# Altium schematic sheet 01_Power_RF.SchDoc: Power & Sensors (part 2 of 4)
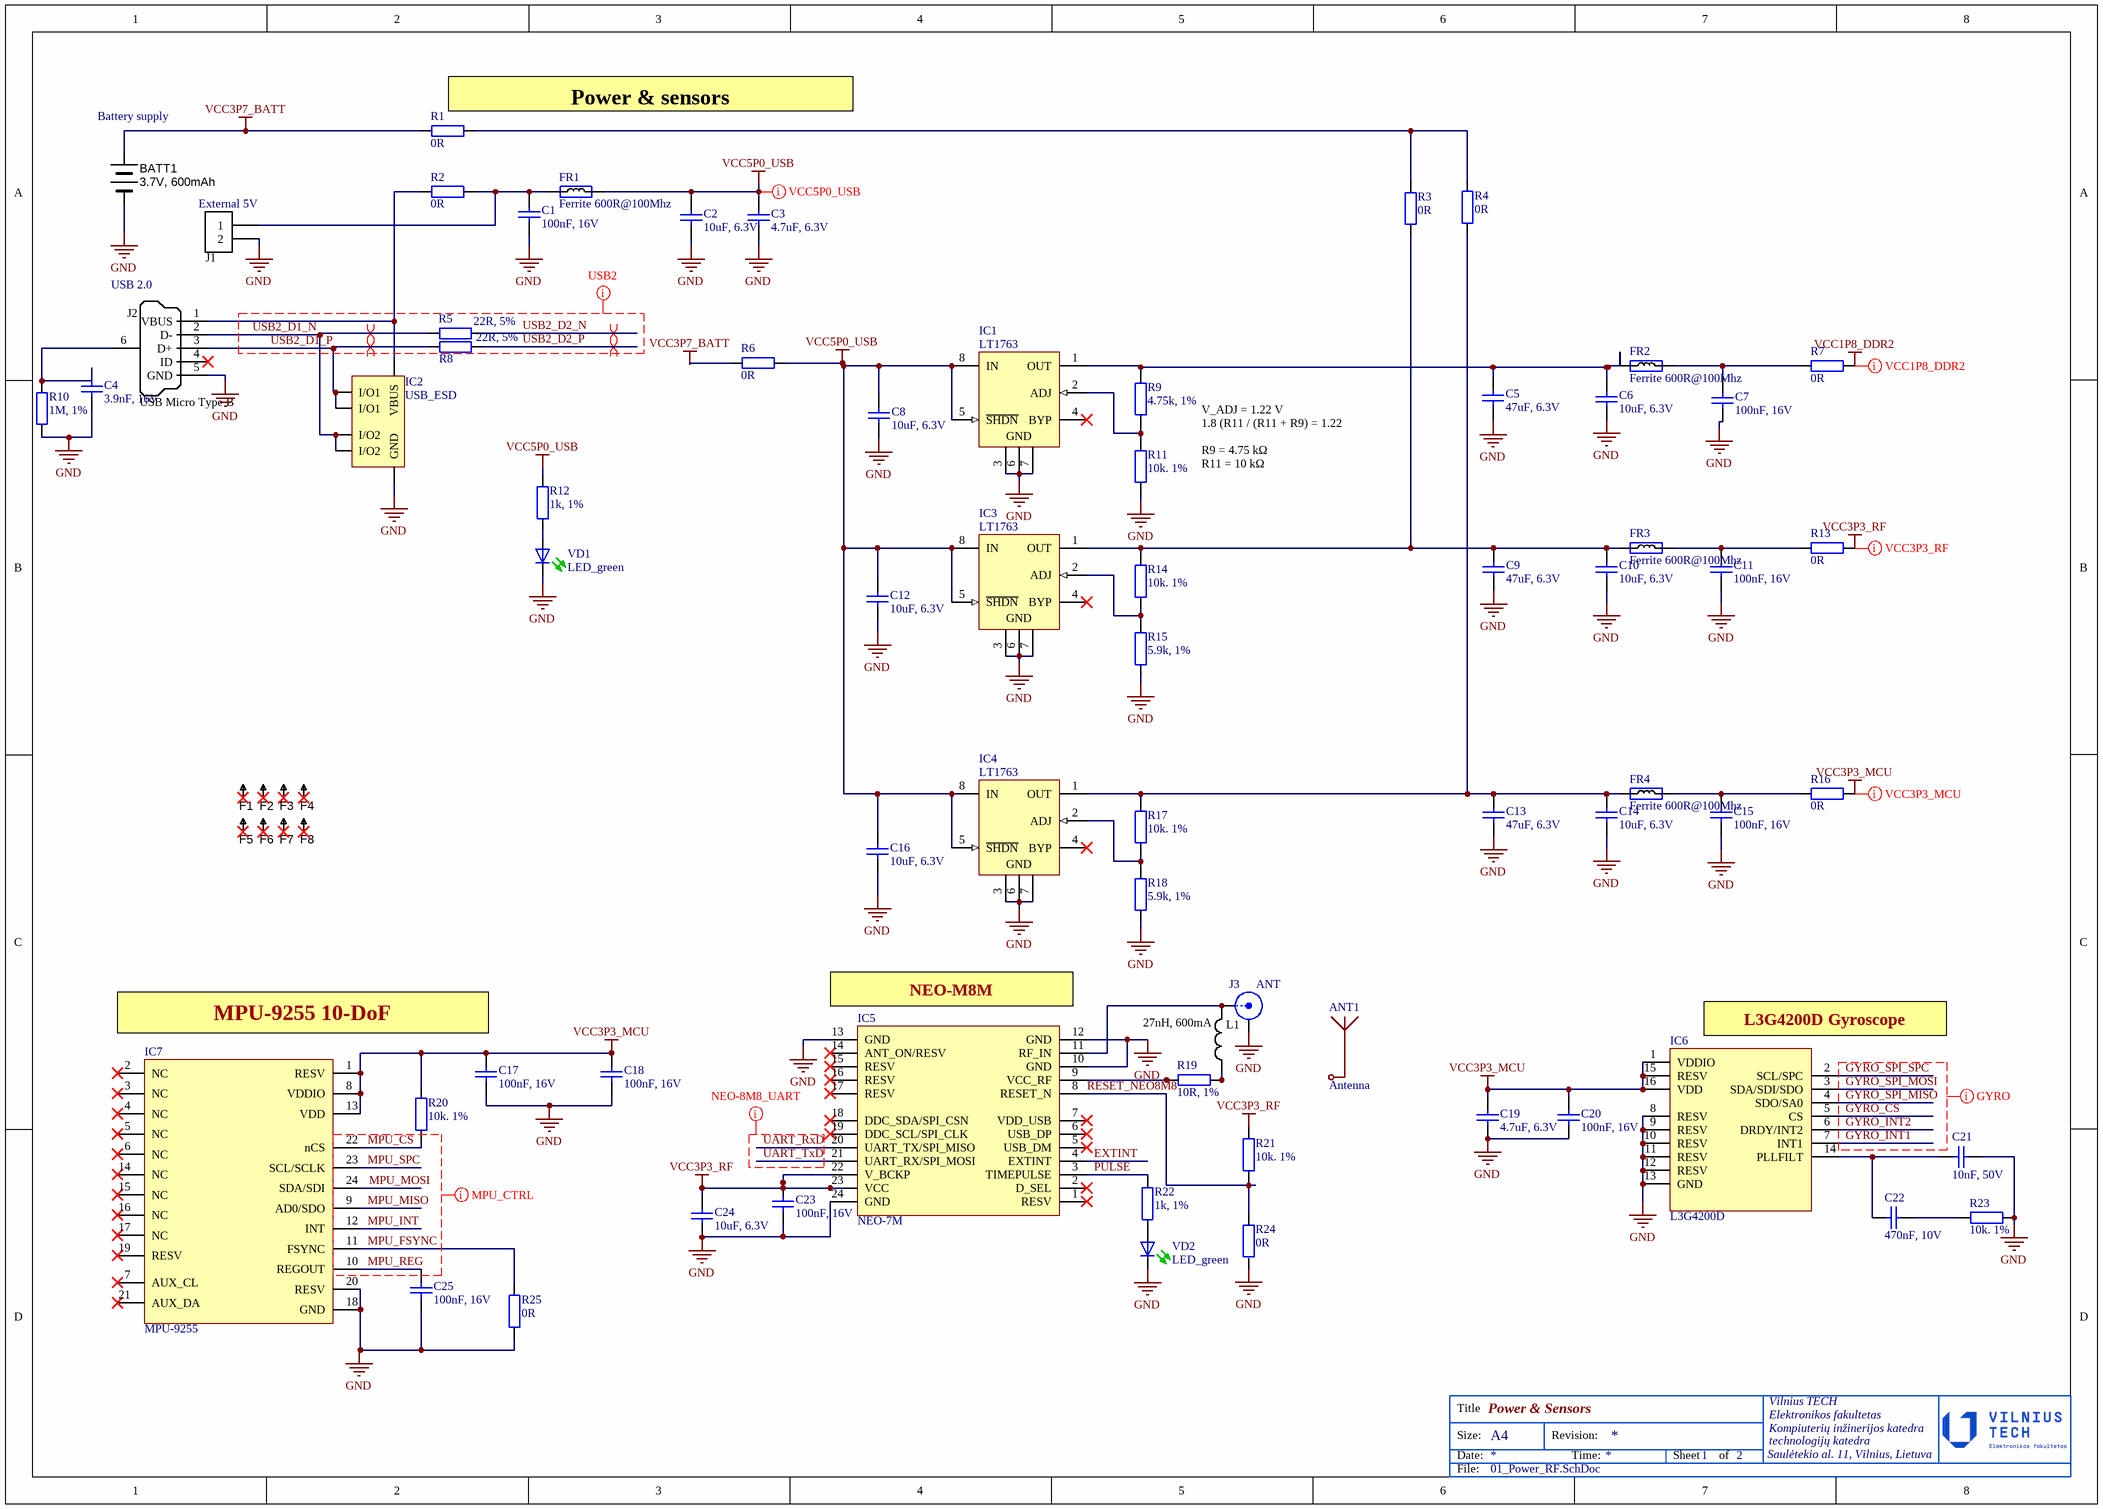
[diagram p1: 01_Power_RF.SchDoc]
## Library data of the parts
BATT1 = BATT: 42.5 x 25.7 x 6.5 mm 3.7 V 600 mAh Rechargeable Lithium Ion Polymer Battery Pack; Manufacturer: Renata; Manufacturer Part Number: ICP622540PMT; Approvals: IEC; Max Charge Current: 300mA; Number of Batteries: 1; Output Current: 600mA; Supplier: Mouser; Supplier Part Number: 614-ICP622540PMT; Category: Batteries and Accessories; Stock: 493; Pricing: 1=14.08, 10=11.74, 50=10.3, 100=9.75, 1000=9.72, 10000=9.72 (USD); Case/Package: 600; Chemistry/Technology: Lithium; Country of Origin: Switzerland; Export Control Classification Number (ECCN) Code: 3A991.J.2; Height: 6.5mm; Harmonized Tariff Schedule (HTS) Code: 8507.80.82.00; Introduction Date: 2018-12-20; Lead Free: Lead Free; Length: 42.5mm; Lifecycle Status: Production; Max Operating Temperature: 60°C; Min Operating Temperature: -20°C; Output Voltage: 3.7V; REACH SVHC: No; Termination: Wire; Voltage: 3.7V; Weight: 11g; Width: 25.7mm; ComponentLink1URL: https://datasheet.octopart.com:443/ICP622540PMT-Renata-datasheet-181185937.pdf?src-supplier=IHS; ComponentLink1Description: https://datasheet.octopart.com:443/ICP622540PMT-Renata-datasheet-181185937.pdf?src-supplier=IHS; ComponentLink2URL: https://datasheet.octopart.com:443/ICP622540PMT-Renata-datasheet-145014577.pdf?src-supplier=Future+Electronics; ComponentLink2Description: https://datasheet.octopart.com:443/ICP622540PMT-Renata-datasheet-145014577.pdf?src-supplier=Future+Electronics; ComponentLink3URL: https://datasheet.octopart.com:443/ICP622540PMT-Renata-datasheet-62059859.pdf?src-supplier=Future+Electronics; ComponentLink3Description: https://datasheet.octopart.com:443/ICP622540PMT-Renata-datasheet-62059859.pdf?src-supplier=Future+Electronics
C1 C7 C11 C15 C17 C18 C20 C23 C25 = Cap: 16V 100nF X7R ±10% 0402 Multilayer Ceramic Capacitors MLCC - SMD/SMT ROHS; Manufacturer: Murata; Manufacturer Part Number: GCM155R71C104KA55D; Manufacturer Lifecycle Status: IN PRODUCTION; Value: 100nF, 16V; Supplier: Farnell; Supplier Part Number: GCM155R71C104KA55D; RoHS: Compliant; Category: Ceramic Capacitors; Stock: 760000; Pricing: 10000=0.0057 (EUR); Case/Package: 0402; Case Code (Imperial): 0402; Case Code (Metric): 1005; Country of Origin: Philippines; Depth: 500µm; Dielectric: X7R; Dielectric Material: Ceramic; Export Control Classification Number (ECCN) Code: EAR99; Height: 500µm; Harmonized Tariff Schedule (HTS) Code: 8532.24.00.20; Introduction Date: 2007-06-21; Lead Free: Lead Free; Length: 1mm; Lifecycle Status: Production; Material: Ceramic; Max Operating Temperature: 125°C; Min Operating Temperature: -55°C; Mounting Technology: Surface Mount; Number of Terminals: 2; Packaging: Cut Tape; Radiation Hardening: No; Ratings: AEC-Q200; REACH SVHC: Yes; Schedule B: 8532240020, 8532240020|8532240020, 8532240020|8532240020|8532240020, 8532240020|8532240020|8532240020|8532240020; Termination: SMD/SMT; Tolerance: 10%; Voltage: 16V; Voltage Rating: 16V; Voltage Rating (DC): 16V; Width: 500µm; ComponentLink1URL: https://datasheet.octopart.com:443/GCM155R71C104KA55D-Murata-datasheet-149522428.pdf?src-supplier=Newark; ComponentLink1Description: https://datasheet.octopart.com:443/GCM155R71C104KA55D-Murata-datasheet-149522428.pdf?src-supplier=Newark; ComponentLink2URL: https://datasheet.octopart.com:443/GCM155R71C104KA55D-Murata-datasheet-11777063.pdf?src-supplier=_legacy+Avnet; ComponentLink2Description: https://datasheet.octopart.com:443/GCM155R71C104KA55D-Murata-datasheet-11777063.pdf?src-supplier=_legacy+Avnet; ComponentLink3URL: https://datasheet.octopart.com:443/GCM155R71C104KA55D-Murata-datasheet-14404342.pdf?src-supplier=Future+Electronics; ComponentLink3Description: https://datasheet.octopart.com:443/GCM155R71C104KA55D-Murata-datasheet-14404342.pdf?src-supplier=Future+Electronics; ComponentLink4URL: https://datasheet.octopart.com:443/GCM155R71C104KA55D-Murata-datasheet-44104237.pdf?src-supplier=Future+Electronics; ComponentLink4Description: https://datasheet.octopart.com:443/GCM155R71C104KA55D-Murata-datasheet-44104237.pdf?src-supplier=Future+Electronics; ComponentLink5URL: https://datasheet.octopart.com:443/GCM155R71C104KA55D-Murata-datasheet-165579661.pdf?src-supplier=TME; ComponentLink5Description: https://datasheet.octopart.com:443/GCM155R71C104KA55D-Murata-datasheet-165579661.pdf?src-supplier=TME; ComponentLink6URL: https://datasheet.octopart.com:443/GCM155R71C104KA55D-Murata-datasheet-62117434.pdf?src-supplier=TME; ComponentLink6Description: https://datasheet.octopart.com:443/GCM155R71C104KA55D-Murata-datasheet-62117434.pdf?src-supplier=TME; ComponentLink7URL: https://datasheet.octopart.com:443/GCM155R71C104KA55D-Murata-datasheet-141266224.pdf?src-supplier=Ciiva; ComponentLink7Description: https://datasheet.octopart.com:443/GCM155R71C104KA55D-Murata-datasheet-141266224.pdf?src-supplier=Ciiva; ComponentLink8URL: https://datasheet.octopart.com:443/GCM155R71C104KA55D-Murata-datasheet-140656701.pdf?src-supplier=Ciiva; ComponentLink8Description: https://datasheet.octopart.com:443/GCM155R71C104KA55D-Murata-datasheet-140656701.pdf?src-supplier=Ciiva; ComponentLink9URL: https://datasheet.octopart.com:443/GCM155R71C104KA55D-Murata-datasheet-138716406.pdf?src-supplier=Ciiva; ComponentLink9Description: https://datasheet.octopart.com:443/GCM155R71C104KA55D-Murata-datasheet-138716406.pdf?src-supplier=Ciiva; ComponentLink10URL: https://datasheet.octopart.com:443/GCM155R71C104KA55D-Murata-datasheet-12515163.pdf?src-supplier=Farnell; ComponentLink10Description: https://datasheet.octopart.com:443/GCM155R71C104KA55D-Murata-datasheet-12515163.pdf?src-supplier=Farnell; ComponentLink11URL: http://sigma.octopart.com:80/reach_statement/Murata-company-16.pdf?src-supplier=Compliance+Statements; ComponentLink11Description: http://sigma.octopart.com:80/reach_statement/Murata-company-16.pdf?src-supplier=Compliance+Statements
C2 C6 C8 C10 C12 C14 C16 C24 = Cap: 6.3V 10uF X5R 卤20% 0402 Multilayer Ceramic Capacitors MLCC - SMD/SMT ROHS; Manufacturer: Samsung Electro-Mechanics; Manufacturer Part Number: CL05A106MQ5NUNC; Tolerance: 20%; Value: 10uF, 6.3V; Supplier: Arrow Electronics; Supplier Part Number: CL05A106MQ5NUNC; RoHS: Compliant; Category: Ceramic Capacitors; Stock: 15790000; Pricing: 10000=0.0171, 20000=0.0168, 30000=0.0166, 50000=0.0158, 70000=0.0157, 100000=0.0154 (USD); Case/Package: 0402; Case Code (Imperial): 0402; Case Code (Metric): 1005; China RoHS: Compliant; Depth: 500µm; Dielectric: X5R; Dielectric Material: Ceramic; Height: 700µm; Length: 1mm; Lifecycle Status: Production; Max Operating Temperature: 85°C; Min Operating Temperature: -55°C; Mounting Technology: Surface Mount; Number of Terminals: 2; Radiation Hardening: No; REACH SVHC: Yes; Schedule B: 8532240020, 8532240020|8532240020, 8532240020|8532240020|8532240020, 8532240020|8532240020|8532240020|8532240020; Thickness: 711.2µm; Voltage Rating: 6.3V; Voltage Rating (DC): 6.3V; Width: 500µm; ComponentLink1URL: https://datasheet.octopart.com:443/CL05A106MQ5NUNC-Samsung-Electro-Mechanics-datasheet-136031724.pdf?src-supplier=Newark; ComponentLink1Description: https://datasheet.octopart.com:443/CL05A106MQ5NUNC-Samsung-Electro-Mechanics-datasheet-136031724.pdf?src-supplier=Newark; ComponentLink2URL: https://datasheet.octopart.com:443/CL05A106MQ5NUNC-Samsung-Electro-Mechanics-datasheet-181551184.pdf?src-supplier=Newark; ComponentLink2Description: https://datasheet.octopart.com:443/CL05A106MQ5NUNC-Samsung-Electro-Mechanics-datasheet-181551184.pdf?src-supplier=Newark; ComponentLink3URL: https://datasheet.octopart.com:443/CL05A106MQ5NUNC-Samsung-Electro-Mechanics-datasheet-110226207.pdf?src-supplier=Future+Electronics; ComponentLink3Description: https://datasheet.octopart.com:443/CL05A106MQ5NUNC-Samsung-Electro-Mechanics-datasheet-110226207.pdf?src-supplier=Future+Electronics; ComponentLink4URL: https://datasheet.octopart.com:443/CL05A106MQ5NUNC-Samsung-Electro-Mechanics-datasheet-81461596.pdf?src-supplier=Future+Electronics; ComponentLink4Description: https://datasheet.octopart.com:443/CL05A106MQ5NUNC-Samsung-Electro-Mechanics-datasheet-81461596.pdf?src-supplier=Future+Electronics; ComponentLink5URL: https://datasheet.octopart.com:443/CL05A106MQ5NUNC-Samsung-datasheet-42280528.pdf?src-supplier=Future+Electronics; ComponentLink5Description: https://datasheet.octopart.com:443/CL05A106MQ5NUNC-Samsung-datasheet-42280528.pdf?src-supplier=Future+Electronics; ComponentLink6URL: https://datasheet.octopart.com:443/CL05A106MQ5NUNC-Samsung-datasheet-34153003.pdf?src-supplier=Future+Electronics; ComponentLink6Description: https://datasheet.octopart.com:443/CL05A106MQ5NUNC-Samsung-datasheet-34153003.pdf?src-supplier=Future+Electronics; ComponentLink7URL: https://datasheet.octopart.com:443/CL05A106MQ5NUNC-Samsung-datasheet-26589001.pdf?src-supplier=Future+Electronics; ComponentLink7Description: https://datasheet.octopart.com:443/CL05A106MQ5NUNC-Samsung-datasheet-26589001.pdf?src-supplier=Future+Electronics; ComponentLink8URL: https://datasheet.octopart.com:443/CL05A106MQ5NUNC-Samsung-datasheet-12538126.pdf?src-supplier=Future+Electronics; ComponentLink8Description: https://datasheet.octopart.com:443/CL05A106MQ5NUNC-Samsung-datasheet-12538126.pdf?src-supplier=Future+Electronics; ComponentLink9URL: https://datasheet.octopart.com:443/CL05A106MQ5NUNC-Samsung-Electro-Mechanics-datasheet-149136671.pdf?src-supplier=Future+Electronics; ComponentLink9Description: https://datasheet.octopart.com:443/CL05A106MQ5NUNC-Samsung-Electro-Mechanics-datasheet-149136671.pdf?src-supplier=Future+Electronics; ComponentLink10URL: https://datasheet.octopart.com:443/CL05A106MQ5NUNC-Samsung-datasheet-59220082.pdf?src-supplier=TME; ComponentLink10Description: https://datasheet.octopart.com:443/CL05A106MQ5NUNC-Samsung-datasheet-59220082.pdf?src-supplier=TME
C3 C19 = Cap: 6.3V 4.7uF X5R 卤20% 0402 Multilayer Ceramic Capacitors MLCC - SMD/SMT ROHS; Manufacturer: Samsung Electro-Mechanics; Manufacturer Part Number: CL05A475MQ5NRNC; Tolerance: 20%; Value: 4.7uF, 6.3V; Supplier: Farnell; Supplier Part Number: CL05A475MQ5NRNC; RoHS: Compliant; Category: Ceramic Capacitors; Stock: 29033; Pricing: 10=0.0525, 100=0.0306, 500=0.0229, 2500=0.0172, 5000=0.0153 (EUR); Case/Package: 0402; Case Code (Imperial): 0402; Case Code (Metric): 1005; China RoHS: Compliant; Depth: 500µm; Dielectric: X5R; Dielectric Material: Ceramic; Height: 650µm; Length: 1mm; Lifecycle Status: Production; Max Operating Temperature: 85°C; Min Operating Temperature: -55°C; Mounting Technology: Surface Mount; Number of Terminals: 2; Radiation Hardening: No; REACH SVHC: Yes; Schedule B: 8532240020, 8532240020|8532240020, 8532240020|8532240020|8532240020, 8532240020|8532240020|8532240020|8532240020; Thickness: 558.8µm; Voltage Rating: 6.3V; Voltage Rating (DC): 6.3V; Width: 500µm; ComponentLink1URL: https://datasheet.octopart.com:443/CL05A475MQ5NRNC-Samsung-Electro-Mechanics-datasheet-136031739.pdf?src-supplier=IHS; ComponentLink1Description: https://datasheet.octopart.com:443/CL05A475MQ5NRNC-Samsung-Electro-Mechanics-datasheet-136031739.pdf?src-supplier=IHS; ComponentLink2URL: https://datasheet.octopart.com:443/CL05A475MQ5NRNC-Samsung-Electro-Mechanics-datasheet-159675397.pdf?src-supplier=ICpick; ComponentLink2Description: https://datasheet.octopart.com:443/CL05A475MQ5NRNC-Samsung-Electro-Mechanics-datasheet-159675397.pdf?src-supplier=ICpick; ComponentLink3URL: https://datasheet.octopart.com:443/CL05A475MQ5NRNC-Samsung-Electro-Mechanics-datasheet-130009127.pdf?src-supplier=Future+Electronics; ComponentLink3Description: https://datasheet.octopart.com:443/CL05A475MQ5NRNC-Samsung-Electro-Mechanics-datasheet-130009127.pdf?src-supplier=Future+Electronics; ComponentLink4URL: https://datasheet.octopart.com:443/CL05A475MQ5NRNC-Samsung-Electro-Mechanics-datasheet-81461613.pdf?src-supplier=Future+Electronics; ComponentLink4Description: https://datasheet.octopart.com:443/CL05A475MQ5NRNC-Samsung-Electro-Mechanics-datasheet-81461613.pdf?src-supplier=Future+Electronics; ComponentLink5URL: https://datasheet.octopart.com:443/CL05A475MQ5NRNC-Samsung-datasheet-34153550.pdf?src-supplier=Future+Electronics; ComponentLink5Description: https://datasheet.octopart.com:443/CL05A475MQ5NRNC-Samsung-datasheet-34153550.pdf?src-supplier=Future+Electronics; ComponentLink6URL: https://datasheet.octopart.com:443/CL05A475MQ5NRNC-Samsung-Electro-Mechanics-datasheet-81842477.pdf?src-supplier=Future+Electronics; ComponentLink6Description: https://datasheet.octopart.com:443/CL05A475MQ5NRNC-Samsung-Electro-Mechanics-datasheet-81842477.pdf?src-supplier=Future+Electronics; ComponentLink7URL: https://datasheet.octopart.com:443/CL05A475MQ5NRNC-Samsung-datasheet-12537359.pdf?src-supplier=Future+Electronics; ComponentLink7Description: https://datasheet.octopart.com:443/CL05A475MQ5NRNC-Samsung-datasheet-12537359.pdf?src-supplier=Future+Electronics; ComponentLink8URL: https://datasheet.octopart.com:443/CL05A475MQ5NRNC-Samsung-datasheet-26589016.pdf?src-supplier=Future+Electronics; ComponentLink8Description: https://datasheet.octopart.com:443/CL05A475MQ5NRNC-Samsung-datasheet-26589016.pdf?src-supplier=Future+Electronics; ComponentLink9URL: https://datasheet.octopart.com:443/CL05A475MQ5NRNC-Samsung-datasheet-8324245.pdf?src-supplier=Future+Electronics; ComponentLink9Description: https://datasheet.octopart.com:443/CL05A475MQ5NRNC-Samsung-datasheet-8324245.pdf?src-supplier=Future+Electronics; ComponentLink10URL: https://datasheet.octopart.com:443/CL05A475MQ5NRNC-Samsung-Electro-Mechanics-datasheet-149136697.pdf?src-supplier=Future+Electronics; ComponentLink10Description: https://datasheet.octopart.com:443/CL05A475MQ5NRNC-Samsung-Electro-Mechanics-datasheet-149136697.pdf?src-supplier=Future+Electronics; ComponentLink11URL: https://datasheet.octopart.com:443/CL05A475MQ5NRNC-Samsung-Electro-Mechanics-datasheet-11778223.pdf?src-supplier=Arrow+Electronics; ComponentLink11Description: https://datasheet.octopart.com:443/CL05A475MQ5NRNC-Samsung-Electro-Mechanics-datasheet-11778223.pdf?src-supplier=Arrow+Electronics; ComponentLink12URL: https://datasheet.octopart.com:443/CL05A475MQ5NRNC-Samsung-datasheet-8326407.pdf?src-supplier=TME; ComponentLink12Description: https://datasheet.octopart.com:443/CL05A475MQ5NRNC-Samsung-datasheet-8326407.pdf?src-supplier=TME
C4 = Cap: Cap, 0.0039Uf, 16V, Mlcc, 0402 Rohs Compliant: Yes |Kemet C0402C392J4JACAUTO; Manufacturer: Yageo Group; Dielectric Material: Ceramic; Voltage Rating (DC): 15V; Value: 3.9nF, 16V; Supplier: Farnell; Supplier Part Number: C0402C392J4JACAUTO; Manufacturer Part Number: C0402C392J4JACAUTO; RoHS: Compliant; Category: Ceramic Capacitors; Stock: 9420; Pricing: 10=0.296, 100=0.185, 500=0.149, 1000=0.126, 2000=0.121, 4000=0.116 (EUR); Case/Package: 0402; China RoHS: Compliant; Country of Origin: Mexico; Export Control Classification Number (ECCN) Code: EAR99; Height: 500µm; Harmonized Tariff Schedule (HTS) Code: 8532.24.00.20; Introduction Date: 2022-03-02; Length: 1mm; Lifecycle Status: Production; Max Operating Temperature: 125°C; Min Operating Temperature: -55°C; Mounting Technology: Surface Mount; Number of Terminals: 2; Ratings: AEC-Q200; REACH SVHC: Yes; Width: 500µm; ComponentLink1URL: https://datasheet.octopart.com:443/C0402C392J4JACAUTO-KEMET-datasheet-175574894.pdf?src-supplier=IHS; ComponentLink1Description: https://datasheet.octopart.com:443/C0402C392J4JACAUTO-KEMET-datasheet-175574894.pdf?src-supplier=IHS; ComponentLink2URL: https://datasheet.octopart.com:443/C0402C392J4JACAUTO-KEMET-datasheet-141421995.pdf?src-supplier=Farnell; ComponentLink2Description: https://datasheet.octopart.com:443/C0402C392J4JACAUTO-KEMET-datasheet-141421995.pdf?src-supplier=Farnell; ComponentLink3URL: https://datasheet.octopart.com:443/C0402C392J4JACAUTO-KEMET-datasheet-176334293.pdf?src-supplier=Newark; ComponentLink3Description: https://datasheet.octopart.com:443/C0402C392J4JACAUTO-KEMET-datasheet-176334293.pdf?src-supplier=Newark; ComponentLink4URL: https://datasheet.octopart.com:443/C0402C392J4JACAUTO-KEMET-datasheet-163667000.pdf?src-supplier=Newark; ComponentLink4Description: https://datasheet.octopart.com:443/C0402C392J4JACAUTO-KEMET-datasheet-163667000.pdf?src-supplier=Newark
C5 C9 C13 = Cap: Multilayer Ceramic Capacitors MLCC - SMD/SMT 47uF 6.3V X5R +/-20% 0805 Gen Purp; Manufacturer: TAIYO YUDEN; Manufacturer Part Number: JMK212BJ476MG-T; Manufacturer Package Identifier: 0805 (2012 metric); Tolerance: 20%; Value: 47uF, 6.3V; Supplier: Mouser; Supplier Part Number: 963-JMK212BJ476MG-T; RoHS: Compliant; Category: Ceramic Capacitors; Stock: 86470; Pricing: 1=0.46, 10=0.206, 50=0.206, 100=0.184, 1000=0.136, 10000=0.109 (USD); Case/Package: 0805; Case Code (Imperial): 0805; Case Code (Metric): 2012; Contact Plating: Nickel; Country of Origin: Japan, Mainland China, Malaysia, South Korea; Depth: 1.25mm; Dielectric: X5R; Dielectric Material: Ceramic; Export Control Classification Number (ECCN) Code: EAR99; Height: 1.25mm; Harmonized Tariff Schedule (HTS) Code: 8532.24.00.20; Introduction Date: 2007-05-22; Lead Free: Lead Free; Length: 2mm; Lifecycle Status: Obsolete; LTB Date: 2026-03-31; LTD Date: 2026-03-31; Max Operating Temperature: 85°C; Min Operating Temperature: -55°C; Mounting Technology: Surface Mount; Pins: 2; Number of Terminals: 2; Packaging: Cut Tape; Radiation Hardening: No; REACH SVHC: Yes; Termination: SMD/SMT; Thickness: 1.3462mm; Voltage Rating: 6.3V; Voltage Rating (DC): 6.3V; Width: 1.25mm; ComponentLink1URL: https://datasheet.octopart.com:443/JMK212BJ476MG-T-Taiyo-Yuden-datasheet-154807738.pdf?src-supplier=Newark; ComponentLink1Description: https://datasheet.octopart.com:443/JMK212BJ476MG-T-Taiyo-Yuden-datasheet-154807738.pdf?src-supplier=Newark; ComponentLink2URL: https://datasheet.octopart.com:443/JMK212BJ476MG-T-Taiyo-Yuden-datasheet-10851928.pdf?src-supplier=Newark; ComponentLink2Description: https://datasheet.octopart.com:443/JMK212BJ476MG-T-Taiyo-Yuden-datasheet-10851928.pdf?src-supplier=Newark; ComponentLink3URL: https://datasheet.octopart.com:443/CEJMK212BJ476MG-T-Taiyo-Yuden-datasheet-159617017.pdf?src-supplier=IHS; ComponentLink3Description: https://datasheet.octopart.com:443/CEJMK212BJ476MG-T-Taiyo-Yuden-datasheet-159617017.pdf?src-supplier=IHS; ComponentLink4URL: https://datasheet.octopart.com:443/JMK212BJ476MG-T-Taiyo-Yuden-datasheet-140424376.pdf?src-supplier=Master+Electronics; ComponentLink4Description: https://datasheet.octopart.com:443/JMK212BJ476MG-T-Taiyo-Yuden-datasheet-140424376.pdf?src-supplier=Master+Electronics; ComponentLink5URL: https://datasheet.octopart.com:443/JMK212BJ476MG-T-Taiyo-Yuden-datasheet-138516745.pdf?src-supplier=Master+Electronics; ComponentLink5Description: https://datasheet.octopart.com:443/JMK212BJ476MG-T-Taiyo-Yuden-datasheet-138516745.pdf?src-supplier=Master+Electronics; ComponentLink6URL: https://datasheet.octopart.com:443/CEJMK212BJ476MG-T-Taiyo-Yuden-datasheet-154807850.pdf?src-supplier=Master+Electronics; ComponentLink6Description: https://datasheet.octopart.com:443/CEJMK212BJ476MG-T-Taiyo-Yuden-datasheet-154807850.pdf?src-supplier=Master+Electronics; ComponentLink7URL: https://datasheet.octopart.com:443/JMK212BJ476MG-T-Taiyo-Yuden-datasheet-99833423.pdf?src-supplier=Future+Electronics; ComponentLink7Description: https://datasheet.octopart.com:443/JMK212BJ476MG-T-Taiyo-Yuden-datasheet-99833423.pdf?src-supplier=Future+Electronics; ComponentLink8URL: https://datasheet.octopart.com:443/JMK212BJ476MG-T-Taiyo-Yuden-datasheet-99833418.pdf?src-supplier=Future+Electronics; ComponentLink8Description: https://datasheet.octopart.com:443/JMK212BJ476MG-T-Taiyo-Yuden-datasheet-99833418.pdf?src-supplier=Future+Electronics; ComponentLink9URL: https://datasheet.octopart.com:443/CEJMK212BJ476MG-T-Taiyo-Yuden-datasheet-62339906.pdf?src-supplier=Electro+Sonic; ComponentLink9Description: https://datasheet.octopart.com:443/CEJMK212BJ476MG-T-Taiyo-Yuden-datasheet-62339906.pdf?src-supplier=Electro+Sonic; ComponentLink10URL: https://datasheet.octopart.com:443/JMK212BJ476MG-T-Taiyo-Yuden-datasheet-62109412.pdf?src-supplier=Electro+Sonic; ComponentLink10Description: https://datasheet.octopart.com:443/JMK212BJ476MG-T-Taiyo-Yuden-datasheet-62109412.pdf?src-supplier=Electro+Sonic; ComponentLink11URL: https://datasheet.octopart.com:443/JMK212BJ476MG-T-Taiyo-Yuden-datasheet-41579547.pdf?src-supplier=Electro+Sonic; ComponentLink11Description: https://datasheet.octopart.com:443/JMK212BJ476MG-T-Taiyo-Yuden-datasheet-41579547.pdf?src-supplier=Electro+Sonic; ComponentLink12URL: https://datasheet.octopart.com:443/JMK212BJ476MG-T-Taiyo-Yuden-datasheet-27089081.pdf?src-supplier=Electro+Sonic; ComponentLink12Description: https://datasheet.octopart.com:443/JMK212BJ476MG-T-Taiyo-Yuden-datasheet-27089081.pdf?src-supplier=Electro+Sonic; ComponentLink13URL: https://datasheet.octopart.com:443/JMK212BJ476MG-T-Taiyo-Yuden-datasheet-13694273.pdf?src-supplier=_legacy+Avnet; ComponentLink13Description: https://datasheet.octopart.com:443/JMK212BJ476MG-T-Taiyo-Yuden-datasheet-13694273.pdf?src-supplier=_legacy+Avnet; ComponentLink14URL: https://datasheet.octopart.com:443/JMK212BJ476MG-T-Taiyo-Yuden-datasheet-10742123.pdf?src-supplier=Factory+Futures; ComponentLink14Description: https://datasheet.octopart.com:443/JMK212BJ476MG-T-Taiyo-Yuden-datasheet-10742123.pdf?src-supplier=Factory+Futures; ComponentLink15URL: https://datasheet.octopart.com:443/JMK212BJ476MG-T-Taiyo-Yuden-datasheet-8857305.pdf?src-supplier=element14; ComponentLink15Description: https://datasheet.octopart.com:443/JMK212BJ476MG-T-Taiyo-Yuden-datasheet-8857305.pdf?src-supplier=element14; ComponentLink16URL: https://datasheet.octopart.com:443/JMK212BJ476MG-T-Taiyo-Yuden-datasheet-8434558.pdf?src-supplier=element14; ComponentLink16Description: https://datasheet.octopart.com:443/JMK212BJ476MG-T-Taiyo-Yuden-datasheet-8434558.pdf?src-supplier=element14; ComponentLink17URL: https://datasheet.octopart.com:443/JMK212BJ476MG-T-Taiyo-Yuden-datasheet-118905.pdf?src-supplier=DigiKey; ComponentLink17Description: https://datasheet.octopart.com:443/JMK212BJ476MG-T-Taiyo-Yuden-datasheet-118905.pdf?src-supplier=DigiKey
C21 = Cap: 50V 10nF X7R ±10% 0402 Multilayer Ceramic Capacitors MLCC - SMD/SMT ROHS; Manufacturer: Murata; Manufacturer Part Number: GCM155R71H103KA55D; Manufacturer Lifecycle Status: IN PRODUCTION; Value: 10nF, 50V; Supplier: Farnell; Supplier Part Number: GCM155R71H103KA55D; RoHS: Compliant; Category: Ceramic Capacitors; Stock: 3754485; Pricing: 10=0.0162, 100=0.0134, 500=0.0096, 2500=0.0076, 5000=0.0067 (EUR); Case/Package: 0402; Case Code (Imperial): 0402; Case Code (Metric): 1005; Country of Origin: Philippines; Depth: 500µm; Dielectric: X7R; Dielectric Material: Ceramic; Export Control Classification Number (ECCN) Code: EAR99; Height: 500µm; Harmonized Tariff Schedule (HTS) Code: 8532.24.00.20; Introduction Date: 2007-06-21; Lead Free: Lead Free; Length: 1mm; Lifecycle Status: Production; Material: Ceramic; Max Operating Temperature: 125°C; Min Operating Temperature: -55°C; Mounting Technology: Surface Mount; Number of Terminals: 2; Packaging: Cut Tape; Radiation Hardening: No; Ratings: AEC-Q200; REACH SVHC: Yes; Schedule B: 8532240020, 8532240020|8532240020, 8532240020|8532240020|8532240020, 8532240020|8532240020|8532240020|8532240020; Termination: SMD/SMT; Tolerance: 10%; Voltage: 50V; Voltage Rating: 50V; Voltage Rating (DC): 50V; Width: 500µm; ComponentLink1URL: https://datasheet.octopart.com:443/GCM155R71H103KA55D-Murata-datasheet-149522462.pdf?src-supplier=Farnell; ComponentLink1Description: https://datasheet.octopart.com:443/GCM155R71H103KA55D-Murata-datasheet-149522462.pdf?src-supplier=Farnell; ComponentLink2URL: https://datasheet.octopart.com:443/GCM155R71H103KA55D-Murata-datasheet-39128434.pdf?src-supplier=Newark; ComponentLink2Description: https://datasheet.octopart.com:443/GCM155R71H103KA55D-Murata-datasheet-39128434.pdf?src-supplier=Newark; ComponentLink3URL: https://datasheet.octopart.com:443/GCM155R71H103KA55D-Murata-datasheet-62316942.pdf?src-supplier=element14+APAC; ComponentLink3Description: https://datasheet.octopart.com:443/GCM155R71H103KA55D-Murata-datasheet-62316942.pdf?src-supplier=element14+APAC; ComponentLink4URL: https://datasheet.octopart.com:443/GCM155R71H103KA55D-Murata-datasheet-12541648.pdf?src-supplier=_legacy+Avnet; ComponentLink4Description: https://datasheet.octopart.com:443/GCM155R71H103KA55D-Murata-datasheet-12541648.pdf?src-supplier=_legacy+Avnet; ComponentLink5URL: https://datasheet.octopart.com:443/GCM155R71H103KA55D-Murata-datasheet-14404350.pdf?src-supplier=Future+Electronics; ComponentLink5Description: https://datasheet.octopart.com:443/GCM155R71H103KA55D-Murata-datasheet-14404350.pdf?src-supplier=Future+Electronics; ComponentLink6URL: https://datasheet.octopart.com:443/GCM155R71H103KA55D-Murata-datasheet-44104302.pdf?src-supplier=Future+Electronics; ComponentLink6Description: https://datasheet.octopart.com:443/GCM155R71H103KA55D-Murata-datasheet-44104302.pdf?src-supplier=Future+Electronics; ComponentLink7URL: https://datasheet.octopart.com:443/GCM155R71H103KA55D-Murata-datasheet-141266224.pdf?src-supplier=Ciiva; ComponentLink7Description: https://datasheet.octopart.com:443/GCM155R71H103KA55D-Murata-datasheet-141266224.pdf?src-supplier=Ciiva; ComponentLink8URL: https://datasheet.octopart.com:443/GCM155R71H103KA55D-Murata-datasheet-140656749.pdf?src-supplier=Ciiva; ComponentLink8Description: https://datasheet.octopart.com:443/GCM155R71H103KA55D-Murata-datasheet-140656749.pdf?src-supplier=Ciiva; ComponentLink9URL: https://datasheet.octopart.com:443/GCM155R71H103KA55D-Murata-datasheet-138716454.pdf?src-supplier=Ciiva; ComponentLink9Description: https://datasheet.octopart.com:443/GCM155R71H103KA55D-Murata-datasheet-138716454.pdf?src-supplier=Ciiva; ComponentLink10URL: https://datasheet.octopart.com:443/GCM155R71H103KA55D-Murata-datasheet-12511495.pdf?src-supplier=TME; ComponentLink10Description: https://datasheet.octopart.com:443/GCM155R71H103KA55D-Murata-datasheet-12511495.pdf?src-supplier=TME; ComponentLink11URL: http://sigma.octopart.com:80/reach_statement/Murata-company-16.pdf?src-supplier=Compliance+Statements; ComponentLink11Description: http://sigma.octopart.com:80/reach_statement/Murata-company-16.pdf?src-supplier=Compliance+Statements
C22 = Cap: 10V 470nF X5R ±10% 0402 Multilayer Ceramic Capacitors MLCC - SMD/SMT ROHS; Manufacturer: Murata; Manufacturer Part Number: GRM155R61A474KE15D; Manufacturer Lifecycle Status: NRND; Manufacturer Package Identifier: GRM15-0.1; Dissipation Factor: 0.1%; Value: 470nF, 10V; Supplier: Arrow Electronics; Supplier Part Number: GRM155R61A474KE15D; RoHS: Compliant; Category: Ceramic Capacitors; Stock: 1130000; Pricing: 10000=0.0133, 20000=0.0132, 30000=0.013, 50000=0.0129, 70000=0.0127, 100000=0.0111 (USD); Case/Package: 0402; Case Code (Imperial): 0402; Case Code (Metric): 1005; Country of Origin: Philippines; Depth: 500µm; Dielectric: X5R; Dielectric Material: Ceramic; Export Control Classification Number (ECCN) Code: EAR99; Height: 500µm; Harmonized Tariff Schedule (HTS) Code: 8532.24.00.20; Introduction Date: 2006-06-22; Lead Free: Lead Free; Length: 1mm; Lifecycle Status: NRND; Material: Ceramic; Max Operating Temperature: 85°C; Min Operating Temperature: -55°C; Mounting Technology: Surface Mount; Pins: 2; Number of Terminals: 2; Packaging: Cut Tape; Radiation Hardening: No; REACH SVHC: Yes; Schedule B: 8532240020, 8532240020|8532240020, 8532240020|8532240020|8532240020, 8532240020|8532240020|8532240020|8532240020; Termination: SMD/SMT; Thickness: 500µm; Tolerance: 10%; Voltage: 10V; Voltage Rating: 10V; Voltage Rating (DC): 10V; Width: 500µm; ComponentLink1URL: https://datasheet.octopart.com:443/GRM155R61A474KE15D-Murata-datasheet-62317107.pdf?src-supplier=element14+APAC; ComponentLink1Description: https://datasheet.octopart.com:443/GRM155R61A474KE15D-Murata-datasheet-62317107.pdf?src-supplier=element14+APAC; ComponentLink2URL: https://datasheet.octopart.com:443/GRM155R61A474KE15D-Murata-datasheet-17853093.pdf?src-supplier=element14+APAC; ComponentLink2Description: https://datasheet.octopart.com:443/GRM155R61A474KE15D-Murata-datasheet-17853093.pdf?src-supplier=element14+APAC; ComponentLink3URL: https://datasheet.octopart.com:443/GRM155R61A474KE15D-Murata-datasheet-8817987.pdf?src-supplier=Newark; ComponentLink3Description: https://datasheet.octopart.com:443/GRM155R61A474KE15D-Murata-datasheet-8817987.pdf?src-supplier=Newark; ComponentLink4URL: https://datasheet.octopart.com:443/GRM155R61A474KE15D-Murata-datasheet-8332149.pdf?src-supplier=_legacy+Avnet; ComponentLink4Description: https://datasheet.octopart.com:443/GRM155R61A474KE15D-Murata-datasheet-8332149.pdf?src-supplier=_legacy+Avnet; ComponentLink5URL: https://datasheet.octopart.com:443/GRM155R61A474KE15D-Murata-datasheet-165579666.pdf?src-supplier=TME; ComponentLink5Description: https://datasheet.octopart.com:443/GRM155R61A474KE15D-Murata-datasheet-165579666.pdf?src-supplier=TME; ComponentLink6URL: https://datasheet.octopart.com:443/GRM155R61A474KE15D-Murata-datasheet-141266224.pdf?src-supplier=Ciiva; ComponentLink6Description: https://datasheet.octopart.com:443/GRM155R61A474KE15D-Murata-datasheet-141266224.pdf?src-supplier=Ciiva; ComponentLink7URL: https://datasheet.octopart.com:443/GRM155R61A474KE15D-Murata-datasheet-140690082.pdf?src-supplier=Ciiva; ComponentLink7Description: https://datasheet.octopart.com:443/GRM155R61A474KE15D-Murata-datasheet-140690082.pdf?src-supplier=Ciiva; ComponentLink8URL: https://datasheet.octopart.com:443/GRM155R61A474KE15D-Murata-datasheet-138740728.pdf?src-supplier=Ciiva; ComponentLink8Description: https://datasheet.octopart.com:443/GRM155R61A474KE15D-Murata-datasheet-138740728.pdf?src-supplier=Ciiva; ComponentLink9URL: https://datasheet.octopart.com:443/GRM155R61A474KE15D-Murata-datasheet-22122223.pdf?src-supplier=Future+Electronics; ComponentLink9Description: https://datasheet.octopart.com:443/GRM155R61A474KE15D-Murata-datasheet-22122223.pdf?src-supplier=Future+Electronics; ComponentLink10URL: https://datasheet.octopart.com:443/GRM155R61A474KE15D-Murata-datasheet-14396880.pdf?src-supplier=Future+Electronics; ComponentLink10Description: https://datasheet.octopart.com:443/GRM155R61A474KE15D-Murata-datasheet-14396880.pdf?src-supplier=Future+Electronics; ComponentLink11URL: https://datasheet.octopart.com:443/GRM155R61A474KE15D-Murata-datasheet-44106186.pdf?src-supplier=Future+Electronics; ComponentLink11Description: https://datasheet.octopart.com:443/GRM155R61A474KE15D-Murata-datasheet-44106186.pdf?src-supplier=Future+Electronics; ComponentLink12URL: https://datasheet.octopart.com/GRM155R61A474KE15D-Murata-datasheet-12515295.pdf; ComponentLink12Description: https://datasheet.octopart.com/GRM155R61A474KE15D-Murata-datasheet-12515295.pdf; ComponentLink13URL: https://datasheet.octopart.com/GRM155R61A474KE15D-Murata-datasheet-12510076.pdf; ComponentLink13Description: https://datasheet.octopart.com/GRM155R61A474KE15D-Murata-datasheet-12510076.pdf; ComponentLink14URL: https://datasheet.octopart.com/GRM155R61A474KE15D-Murata-datasheet-11978611.pdf; ComponentLink14Description: https://datasheet.octopart.com/GRM155R61A474KE15D-Murata-datasheet-11978611.pdf; ComponentLink15URL: https://datasheet.octopart.com/GRM155R61A474KE15D-Murata-datasheet-10025737.pdf; ComponentLink15Description: https://datasheet.octopart.com/GRM155R61A474KE15D-Murata-datasheet-10025737.pdf; ComponentLink16URL: https://datasheet.octopart.com/GRM155R61A474KE15D-Murata-datasheet-8819587.pdf; ComponentLink16Description: https://datasheet.octopart.com/GRM155R61A474KE15D-Murata-datasheet-8819587.pdf; ComponentLink17URL: https://datasheet.octopart.com/GRM155R61A474KE15D-Murata-datasheet-14396879.pdf; ComponentLink17Description: https://datasheet.octopart.com/GRM155R61A474KE15D-Murata-datasheet-14396879.pdf; ComponentLink18URL: https://datasheet.octopart.com:443/GRM155R61A474KE15D-Murata-datasheet-11969797.pdf?src-supplier=Arrow+Electronics; ComponentLink18Description: https://datasheet.octopart.com:443/GRM155R61A474KE15D-Murata-datasheet-11969797.pdf?src-supplier=Arrow+Electronics; ComponentLink19URL: https://datasheet.octopart.com:443/GRM155R61A474KE15D-Murata-datasheet-118811.pdf?src-supplier=DigiKey; ComponentLink19Description: https://datasheet.octopart.com:443/GRM155R61A474KE15D-Murata-datasheet-118811.pdf?src-supplier=DigiKey; ComponentLink20URL: http://sigma.octopart.com:80/reach_statement/Murata-company-16.pdf?src-supplier=Compliance+Statements; ComponentLink20Description: http://sigma.octopart.com:80/reach_statement/Murata-company-16.pdf?src-supplier=Compliance+Statements
FR1-FR4 = Ferrite: Ferrite Beads Multi-Layer 600Ohm 25% 100MHz 500mA 380mOhm DCR 0603 Automotive Paper T/R; Manufacturer: Murata; Manufacturer Part Number: BLM18AG601SN1D; DC Resistance (DCR): 380mΩ; Impedance: 600Ω; Number of Circuits: 1; Value: 380mΩ; Shielding: Unshielded; Supplier: Farnell; Supplier Part Number: BLM18AG601SN1D; RoHS: Compliant; Category: Ferrite Beads and Chips; Stock: 228982; Pricing: 10=0.0535, 100=0.0382, 500=0.0296, 1000=0.0258, 2000=0.023, 4000=0.0201 (EUR); Case/Package: 0603; Case Code (Imperial): 0603; Case Code (Metric): 1608; Core Material: Ferrite; Country of Origin: Japan, Thailand; Current Rating: 500mA; DC Current: 500mA; Depth: 800µm; Export Control Classification Number (ECCN) Code: EAR99; Frequency: 100MHz; Height: 800µm; Harmonized Tariff Schedule (HTS) Code: 8504.50.80.00; Introduction Date: 2001-08-28; Lead Free: Lead Free; Length: 1.6mm; Lifecycle Status: Production; Material: Ferrite, Steel; Max Current Rating: 500mA; Max DC Current: 500mA; Clock Frequency: 100MHz; Max Operating Temperature: 125°C; Military Standard: Not; Min Operating Temperature: -55°C; Mounting Technology: Surface Mount; Number of Lines: 1; Pins: 2; Number of Terminals: 2; Packaging: Cut Tape; Radiation Hardening: No; REACH SVHC: Yes; RMS Current (Irms): 500mA; Schedule B: 8543706000, 8543706000|8543706000, 8543706000|8543706000|8543706000, 8543706000|8543706000|8543706000|8543706000; ESR: 380mΩ; Termination: SMD/SMT; Test Frequency: 100MHz; Tolerance: 25%; Weight: 2.012816mg; Width: 800µm; ComponentLink1URL: https://datasheet.octopart.com:443/BLM18AG601SN1D-Murata-datasheet-180806579.pdf?src-supplier=IHS; ComponentLink1Description: https://datasheet.octopart.com:443/BLM18AG601SN1D-Murata-datasheet-180806579.pdf?src-supplier=IHS; ComponentLink2URL: https://datasheet.octopart.com:443/BLM18AG601SN1D-Murata-datasheet-41195.pdf?src-supplier=Upverter; ComponentLink2Description: https://datasheet.octopart.com:443/BLM18AG601SN1D-Murata-datasheet-41195.pdf?src-supplier=Upverter; ComponentLink3URL: https://datasheet.octopart.com:443/BLM18AG601SN1D-Murata-datasheet-11743096.pdf?src-supplier=Newark; ComponentLink3Description: https://datasheet.octopart.com:443/BLM18AG601SN1D-Murata-datasheet-11743096.pdf?src-supplier=Newark; ComponentLink4URL: https://datasheet.octopart.com:443/BLM18AG601SN1D-Murata-datasheet-5338592.pdf?src-supplier=Newark; ComponentLink4Description: https://datasheet.octopart.com:443/BLM18AG601SN1D-Murata-datasheet-5338592.pdf?src-supplier=Newark; ComponentLink5URL: https://datasheet.octopart.com:443/BLM18AG601SN1D-Murata-datasheet-511221.pdf?src-supplier=TME; ComponentLink5Description: https://datasheet.octopart.com:443/BLM18AG601SN1D-Murata-datasheet-511221.pdf?src-supplier=TME; ComponentLink6URL: https://datasheet.octopart.com:443/BLM18AG601SN1D-Murata-datasheet-135086656.pdf?src-supplier=TME; ComponentLink6Description: https://datasheet.octopart.com:443/BLM18AG601SN1D-Murata-datasheet-135086656.pdf?src-supplier=TME; ComponentLink7URL: https://datasheet.octopart.com:443/BLM18AG601SN1D-Murata-datasheet-5396529.pdf?src-supplier=Factory+Futures; ComponentLink7Description: https://datasheet.octopart.com:443/BLM18AG601SN1D-Murata-datasheet-5396529.pdf?src-supplier=Factory+Futures; ComponentLink8URL: https://datasheet.octopart.com:443/BLM18AG601SN1D-Murata-datasheet-141257898.pdf?src-supplier=Ciiva; ComponentLink8Description: https://datasheet.octopart.com:443/BLM18AG601SN1D-Murata-datasheet-141257898.pdf?src-supplier=Ciiva; ComponentLink9URL: https://datasheet.octopart.com:443/BLM18AG601SN1D-Murata-datasheet-138706784.pdf?src-supplier=Ciiva; ComponentLink9Description: https://datasheet.octopart.com:443/BLM18AG601SN1D-Murata-datasheet-138706784.pdf?src-supplier=Ciiva; ComponentLink10URL: https://datasheet.octopart.com:443/BLM18AG601SN1D-Murata-datasheet-78375072.pdf?src-supplier=Future+Electronics; ComponentLink10Description: https://datasheet.octopart.com:443/BLM18AG601SN1D-Murata-datasheet-78375072.pdf?src-supplier=Future+Electronics; ComponentLink11URL: https://datasheet.octopart.com:443/BLM18AG601SN1D-Murata-datasheet-58177255.pdf?src-supplier=Future+Electronics; ComponentLink11Description: https://datasheet.octopart.com:443/BLM18AG601SN1D-Murata-datasheet-58177255.pdf?src-supplier=Future+Electronics; ComponentLink12URL: https://datasheet.octopart.com/BLM18AG601SN1D-Murata-datasheet-37129980.pdf; ComponentLink12Description: https://datasheet.octopart.com/BLM18AG601SN1D-Murata-datasheet-37129980.pdf; ComponentLink13URL: https://datasheet.octopart.com:443/BLM18AG601SN1D-Murata-datasheet-14066397.pdf?src-supplier=iiiC; ComponentLink13Description: https://datasheet.octopart.com:443/BLM18AG601SN1D-Murata-datasheet-14066397.pdf?src-supplier=iiiC; ComponentLink14URL: https://datasheet.octopart.com:443/BLM18AG601SN1D-Murata-datasheet-9604654.pdf?src-supplier=RS+(Formerly+Allied+Electronics); ComponentLink14Description: https://datasheet.octopart.com:443/BLM18AG601SN1D-Murata-datasheet-9604654.pdf?src-supplier=RS+(Formerly+Allied+Electronics); ComponentLink15URL: https://datasheet.octopart.com:443/BLM18AG601SN1D-Murata-datasheet-13143.pdf?src-supplier=RS+(Formerly+Allied+Electronics); ComponentLink15Description: https://datasheet.octopart.com:443/BLM18AG601SN1D-Murata-datasheet-13143.pdf?src-supplier=RS+(Formerly+Allied+Electronics); ComponentLink16URL: https://datasheet.octopart.com:443/BLM18AG601SN1D-Murata-datasheet-7628479.pdf?src-supplier=Jameco; ComponentLink16Description: https://datasheet.octopart.com:443/BLM18AG601SN1D-Murata-datasheet-7628479.pdf?src-supplier=Jameco; ComponentLink17URL: https://datasheet.octopart.com:443/BLM18AG601SN1D-Murata-datasheet-11030792.pdf?src-supplier=Farnell; ComponentLink17Description: https://datasheet.octopart.com:443/BLM18AG601SN1D-Murata-datasheet-11030792.pdf?src-supplier=Farnell; ComponentLink18URL: http://sigma.octopart.com:80/reach_statement/Murata-company-16.pdf?src-supplier=Compliance+Statements; ComponentLink18Description: http://sigma.octopart.com:80/reach_statement/Murata-company-16.pdf?src-supplier=Compliance+Statements
IC1 IC3 IC4 = LT1763MPS8: 500 mA, Low Noise, LDO Micropower Regulator, 1.8 to 20 V Vin, Adjustable Vout, 8-pin SOIC (S8-8), -55 to 125 degC; Manufacturer: Linear Technology; Discrete Pass Element: no; Dropout Voltage(V): 0.3; Iout(mA): 500; Isupply(mA): 0.03; Noise(uV): 20; Number of Outputs: 1; Output Voltage: Adj; PSRR(dB): 65; Vin Min(V): 1.8; Vout Min(V): 1.22; DatasheetVersion: Rev. G; PackageVersion: Rev. G, 03/2012; PackageReference: S8-8; PackageDescription: 8-Pin Plastic Small Outline (Narrow .150 Inch), Body 4.9 x 3.9 mm, Pitch 1.27 mm; Supplier 1: Newark; Supplier Part Number 1: 57M6069; RoHS: FALSE; Shutdown Current(uA): 1; Vin Max(V): 20; Vout Max(V): 20; Mounting Technology: Surface Mount; PartNumber: LT1763MPS8; ComponentLink1Description: Manufacturer URL; ComponentLink1URL: http://www.linear.com/; ComponentLink2Description: Datasheet; ComponentLink2URL: http://cds.linear.com/docs/en/datasheet/1763fg.pdf; ComponentLink3Description: Package Specification; ComponentLink3URL: http://cds.linear.com/docs/en/packaging/05081610_G_SO8.pdf
IC2 = USBULC6-2P6: Manufacturer: STMicroelectronics; Current - Peak Pulse (10/1000µs): 5A (8/20µs); Capacitance @ Frequency: 1pF @ 1MHz; Bidirectional Channels: 2; Voltage - Reverse Standoff (Typ): 5V; Voltage - Breakdown (Min): 6V; Power Line Protection: Yes; Voltage - Clamping (Max) @ Ipp: 17V; Supplier 1: Digi-Key; Unidirectional Channels: -; Mounting Type: Surface Mount; Applications: Ethernet; Manufacturer Part Number 1: USBULC6-2P6; Type: Steering (Rail to Rail); Power - Peak Pulse: -; Category: Circuit Protection; Supplier Device Package: SOT-666; Package / Case: SOT-563, SOT-666; Packaging: Cut Tape (CT); Operating Temperature: -; RoHS: RoHS Compliant; Supplier Part Number 1: 497-15162-1-ND
IC5 = NEO-7M: NEO-M8 Series 1.575GHz -167dBm BeiDou Galileo GLONASS GNSS GPS Concurrent Module; Manufacturer: U-blox; Manufacturer Part Number: NEO-M8M-0; Number of Circuits: 1; Operating Supply Voltage: 3V; DatasheetVersion: R07 11-Nov-2014; PackageDescription: NEO-7 series 12.2 x 16 x 2.4 mm; ComponentLink1URL: https://www.u-blox.com/en/product/neo-7-series; ComponentLink2Description: Datasheet; ComponentLink1Description: https://www.u-blox.com/en/product/neo-7-series; Supplier: Mouser; Supplier Part Number: 377-NEO-M8M-0; RoHS: Compliant; Category: RF Receivers, Transceivers; Stock: 605; Pricing: 1=21.26, 10=20.18, 50=16.56, 100=13.27, 1000=13.27, 10000=13.27 (USD); Height - Seated (Max): 2.6mm; Introduction Date: 2016-04-08; Length: 16mm; Lifecycle Status: Production; Max Operating Temperature: 85°C; Min Operating Temperature: -40°C; Number of Terminals: 24; Ratings: AEC-Q100; REACH SVHC: Yes; Temperature Grade: Industrial; Terminal Pitch: 1.1mm; Width: 12.2mm; ComponentLink3URL: https://datasheet.octopart.com:443/NEO-M8M-0-u-blox-datasheet-181463448.pdf?src-supplier=IHS; ComponentLink3Description: https://datasheet.octopart.com:443/NEO-M8M-0-u-blox-datasheet-181463448.pdf?src-supplier=IHS; ComponentLink4URL: https://datasheet.octopart.com:443/NEO-M8M-0-u-blox-datasheet-166811445.pdf?src-supplier=TME; ComponentLink4Description: https://datasheet.octopart.com:443/NEO-M8M-0-u-blox-datasheet-166811445.pdf?src-supplier=TME; ComponentLink5URL: https://datasheet.octopart.com:443/NEO-M8M-0-u-blox-datasheet-166811443.pdf?src-supplier=TME; ComponentLink5Description: https://datasheet.octopart.com:443/NEO-M8M-0-u-blox-datasheet-166811443.pdf?src-supplier=TME; ComponentLink6URL: https://datasheet.octopart.com:443/NEO-M8M-0-u-blox-datasheet-100446454.pdf?src-supplier=TME; ComponentLink6Description: https://datasheet.octopart.com:443/NEO-M8M-0-u-blox-datasheet-100446454.pdf?src-supplier=TME; ComponentLink7URL: https://datasheet.octopart.com:443/NEO-M8M-0-u-blox-datasheet-163637401.pdf?src-supplier=Future+Electronics; ComponentLink7Description: https://datasheet.octopart.com:443/NEO-M8M-0-u-blox-datasheet-163637401.pdf?src-supplier=Future+Electronics
IC6 = L3G4200D: MEMS motion sensor: three-axis digital output gyroscope; Manufacturer: STMicroelectronics; Interface: I2C, SPI, Serial; Max Supply Voltage: 3.6V; Min Supply Voltage: 2.4V; Number of Circuits: 1; Operating Supply Current: 6.1mA; Operating Supply Voltage: 3V; Output Type: Digital, I2C, SPI; Resolution: 2B; Sensor Type: 3 Axis; DatasheetVersion: Doc ID 17116 Rev 3; PackageDescription: LGA-16 (4x4x1.1 mm); ComponentLink1URL: http://www.st.com/web/en/resource/technical/document/datasheet/CD00265057.pdf; ComponentLink2Description: Datasheet; ComponentLink1Description: http://www.st.com/web/en/resource/technical/document/datasheet/CD00265057.pdf; Supplier: Farnell; Supplier Part Number: L3G4200D; Manufacturer Part Number: L3G4200D; RoHS: Compliant; Category: Gyroscopes; Pricing: 1=6.28, 10=6.06, 100=5.83, 300=5.61, 800=5.38, 2000=5.16, 3000=4.93 (EUR); Case/Package: TFLGA; China RoHS: Non-Compliant; Depth: 4mm; Height: 1mm; Height - Seated (Max): 1.1mm; Harmonized Tariff Schedule (HTS) Code: 8542.39.00.01; Introduction Date: 2010-02-12; Lead Free: Lead Free; Length: 4mm; Lifecycle Status: Obsolete; LTB Date: 2015-07-23; LTD Date: 2016-01-23; Max Operating Temperature: 85°C; Max Supply Voltage (DC): 3.6V; Min Operating Temperature: -40°C; Min Supply Voltage (DC): 2.4V; Mounting Technology: Surface Mount; Pins: 16; Number of Terminals: 16; Radiation Hardening: No; REACH SVHC: Yes; Temperature Grade: Industrial; Terminal Pitch: 650µm; Width: 4mm; ComponentLink3URL: https://datasheet.octopart.com:443/L3G4200D-STMicroelectronics-datasheet-10837909.pdf?src-supplier=IHS; ComponentLink3Description: https://datasheet.octopart.com:443/L3G4200D-STMicroelectronics-datasheet-10837909.pdf?src-supplier=IHS; ComponentLink4URL: https://datasheet.octopart.com:443/L3G4200D-STMicroelectronics-datasheet-23704525.pdf?src-supplier=STMicroelectronics; ComponentLink4Description: https://datasheet.octopart.com:443/L3G4200D-STMicroelectronics-datasheet-23704525.pdf?src-supplier=STMicroelectronics; ComponentLink5URL: https://datasheet.octopart.com:443/L3G4200D-STMicroelectronics-datasheet-15943594.pdf?src-supplier=iiiC; ComponentLink5Description: https://datasheet.octopart.com:443/L3G4200D-STMicroelectronics-datasheet-15943594.pdf?src-supplier=iiiC; ComponentLink6URL: https://datasheet.octopart.com:443/L3G4200D-STMicroelectronics-datasheet-10030983.pdf?src-supplier=Farnell; ComponentLink6Description: https://datasheet.octopart.com:443/L3G4200D-STMicroelectronics-datasheet-10030983.pdf?src-supplier=Farnell; ComponentLink7URL: https://datasheet.octopart.com:443/L3G4200D-STMicroelectronics-datasheet-10413738.pdf?src-supplier=Farnell; ComponentLink7Description: https://datasheet.octopart.com:443/L3G4200D-STMicroelectronics-datasheet-10413738.pdf?src-supplier=Farnell
IC7 = MPU-9255: The MPU-9255 is a 3-axis gyroscope, 3-axis accelerometer, and 3-axis digital compass designed specifically for Automatic Activity Recognition library (AAR™) in a 3 x 3 mm package; Manufacturer: InvenSense; DatasheetVersion: Release Date: 09/14/2014; PackageDescription: 24-Pin 3X3X1 QFN; ComponentLink1URL: http://www.invensense.com/; ComponentLink2Description: Datasheet; ComponentLink2URL: http://43zrtwysvxb2gf29r5o0athu.wpengine.netdna-cdn.com/wp-content/uploads/2015/01/PS-MPU-92551.pdf; ComponentLink1Description: http://www.invensense.com/products/motion-tracking/9-axis/mpu-9255-2/